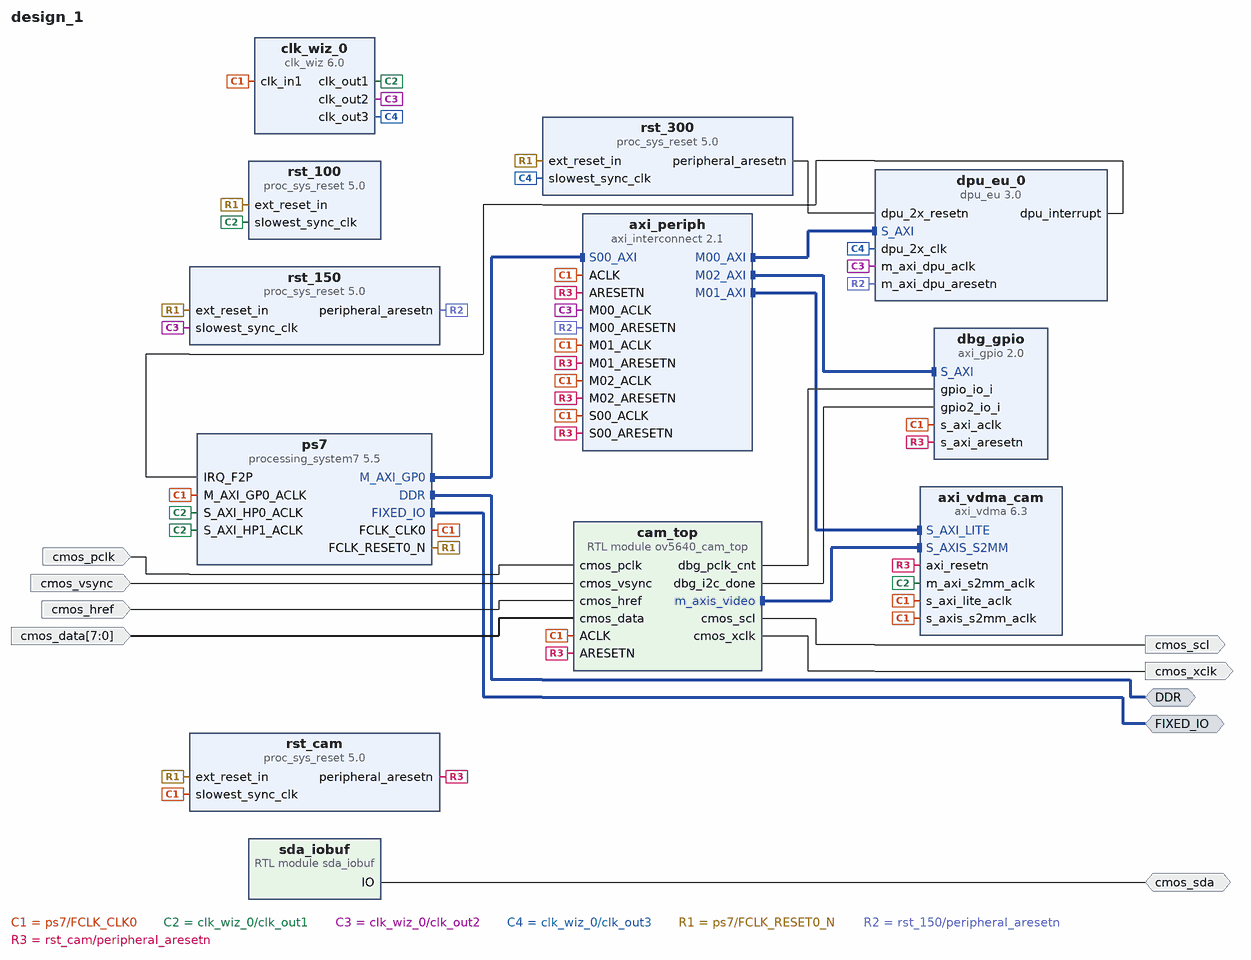
[diagram p0: block diagram of the top level]
# Vivado block design design_1, xc7z020clg400-2, Vivado 2019.1
create_bd_design design_1

create_bd_intf_port -mode Master -vlnv xilinx.com:interface:ddrx_rtl:1.0 DDR
create_bd_intf_port -mode Master -vlnv xilinx.com:display_processing_system7:fixedio_rtl:1.0 FIXED_IO
create_bd_port -dir O cmos_xclk
create_bd_port -dir O cmos_scl
create_bd_port -dir I cmos_pclk
create_bd_port -dir I cmos_vsync
create_bd_port -dir I cmos_href
create_bd_port -dir I -from 7 -to 0 cmos_data
create_bd_port -dir IO cmos_sda

create_bd_cell -type ip -vlnv xilinx.com:ip:processing_system7:5.5 ps7
set_property -dict [list \
  CONFIG.PCW_APU_PERIPHERAL_FREQMHZ 666.666666 \
  CONFIG.PCW_ENET0_ENET0_IO EMIO \
  CONFIG.PCW_ENET0_GRP_MDIO_ENABLE 0 \
  CONFIG.PCW_ENET0_PERIPHERAL_ENABLE 1 \
  CONFIG.PCW_ENET1_PERIPHERAL_CLKSRC External \
  CONFIG.PCW_FCLK_CLK0_BUF FALSE \
  CONFIG.PCW_FPGA0_PERIPHERAL_FREQMHZ 50 \
  CONFIG.PCW_FPGA1_PERIPHERAL_FREQMHZ 200 \
  CONFIG.PCW_GP0_EN_MODIFIABLE_TXN 0 \
  CONFIG.PCW_GP1_EN_MODIFIABLE_TXN 0 \
  CONFIG.PCW_GPIO_MIO_GPIO_ENABLE 0 \
  CONFIG.PCW_IRQ_F2P_INTR 1 \
  CONFIG.PCW_PERIPHERAL_BOARD_PRESET None \
  CONFIG.PCW_PRESET_BANK1_VOLTAGE {LVCMOS 1.8V} \
  CONFIG.PCW_QSPI_GRP_SINGLE_SS_ENABLE 1 \
  CONFIG.PCW_QSPI_GRP_SINGLE_SS_IO {MIO 1 .. 6} \
  CONFIG.PCW_QSPI_PERIPHERAL_ENABLE 1 \
  CONFIG.PCW_QSPI_PERIPHERAL_FREQMHZ 125 \
  CONFIG.PCW_QSPI_QSPI_IO {MIO 1 .. 6} \
  CONFIG.PCW_SD0_GRP_CD_ENABLE 0 \
  CONFIG.PCW_SD0_GRP_WP_ENABLE 0 \
  CONFIG.PCW_SD0_PERIPHERAL_ENABLE 1 \
  CONFIG.PCW_SD0_SD0_IO {MIO 40 .. 45} \
  CONFIG.PCW_SD1_PERIPHERAL_ENABLE 1 \
  CONFIG.PCW_SD1_SD1_IO {MIO 10 .. 15} \
  CONFIG.PCW_SDIO_PERIPHERAL_FREQMHZ 100 \
  CONFIG.PCW_SINGLE_QSPI_DATA_MODE x4 \
  CONFIG.PCW_UART1_PERIPHERAL_ENABLE 1 \
  CONFIG.PCW_UART1_UART1_IO {MIO 48 .. 49} \
  CONFIG.PCW_UART_PERIPHERAL_FREQMHZ 100 \
  CONFIG.PCW_USB0_PERIPHERAL_ENABLE 1 \
  CONFIG.PCW_USB0_USB0_IO {MIO 28 .. 39} \
  CONFIG.PCW_USE_FABRIC_INTERRUPT 1 \
  CONFIG.PCW_USE_S_AXI_HP0 1 \
  CONFIG.PCW_USE_S_AXI_HP1 1 \
] [get_bd_cells ps7]
# 367 more settings of ps7 are not shown: defaults, MIO pin electricals, DDR timing, and values the tool derives
create_bd_cell -type ip -vlnv xilinx.com:ip:clk_wiz:6.0 clk_wiz_0
set_property -dict [list \
  CONFIG.CLKOUT1_REQUESTED_OUT_FREQ 100.000 \
  CONFIG.CLKOUT1_USED true \
  CONFIG.CLKOUT2_REQUESTED_OUT_FREQ 150.000 \
  CONFIG.CLKOUT2_USED true \
  CONFIG.CLKOUT3_REQUESTED_OUT_FREQ 300.000 \
  CONFIG.CLKOUT3_USED true \
  CONFIG.PRIM_IN_FREQ 50 \
  CONFIG.USE_LOCKED true \
  CONFIG.USE_PHASE_ALIGNMENT false \
  CONFIG.USE_RESET true \
] [get_bd_cells clk_wiz_0]
create_bd_cell -type ip -vlnv xilinx.com:ip:proc_sys_reset:5.0 rst_100
create_bd_cell -type ip -vlnv xilinx.com:ip:proc_sys_reset:5.0 rst_150
create_bd_cell -type ip -vlnv xilinx.com:ip:proc_sys_reset:5.0 rst_300
create_bd_cell -type ip -vlnv xilinx.com:ip:proc_sys_reset:5.0 rst_cam
create_bd_cell -type ip -vlnv xilinx.com:ip:dpu_eu:3.0 dpu_eu_0
set_property -dict [list \
  CONFIG.ARCH 1152 \
  CONFIG.CONV_RELU_ADDON 2 \
  CONFIG.DWCV_ENA 1 \
  CONFIG.LOAD_AUGM 0 \
  CONFIG.POOL_AVERAGE 0 \
  CONFIG.S_AXI_CLK_INDEPENDENT 0 \
  CONFIG.TIME_DAY 9 \
  CONFIG.TIME_HOUR 14 \
  CONFIG.TIME_MONTH 10 \
  CONFIG.TIME_QUARTER 2 \
  CONFIG.TIME_YEAR 26 \
  CONFIG.VER_DPU_NUM 1 \
] [get_bd_cells dpu_eu_0]
create_bd_cell -type ip -vlnv xilinx.com:ip:axi_vdma:6.3 axi_vdma_cam
set_property -dict [list \
  CONFIG.c_addr_width 32 \
  CONFIG.c_include_mm2s 0 \
  CONFIG.c_include_s2mm 1 \
  CONFIG.c_num_fstores 3 \
  CONFIG.c_s2mm_genlock_mode 0 \
  CONFIG.c_s2mm_max_burst_length 64 \
] [get_bd_cells axi_vdma_cam]
create_bd_cell -type module -reference ov5640_cam_top cam_top
create_bd_cell -type module -reference sda_iobuf sda_iobuf
create_bd_cell -type ip -vlnv xilinx.com:ip:axi_interconnect:2.1 axi_periph
set_property -dict {CONFIG.NUM_MI 3 CONFIG.NUM_SI 1} [get_bd_cells axi_periph]
create_bd_cell -type ip -vlnv xilinx.com:ip:axi_gpio:2.0 dbg_gpio
set_property -dict [list \
  CONFIG.C_ALL_INPUTS 1 \
  CONFIG.C_ALL_INPUTS_2 1 \
  CONFIG.C_GPIO2_WIDTH 1 \
  CONFIG.C_GPIO_WIDTH 8 \
  CONFIG.C_IS_DUAL 1 \
] [get_bd_cells dbg_gpio]

# ---- connections ----

connect_bd_intf_net [get_bd_intf_ports DDR] [get_bd_intf_pins ps7/DDR]
connect_bd_intf_net [get_bd_intf_ports FIXED_IO] [get_bd_intf_pins ps7/FIXED_IO]
connect_bd_intf_net [get_bd_intf_pins cam_top/m_axis_video] [get_bd_intf_pins axi_vdma_cam/S_AXIS_S2MM]
connect_bd_intf_net [get_bd_intf_pins axi_periph/M02_AXI] [get_bd_intf_pins dbg_gpio/S_AXI]
connect_bd_intf_net [get_bd_intf_pins ps7/M_AXI_GP0] [get_bd_intf_pins axi_periph/S00_AXI]
connect_bd_intf_net [get_bd_intf_pins axi_periph/M01_AXI] [get_bd_intf_pins axi_vdma_cam/S_AXI_LITE]
connect_bd_intf_net [get_bd_intf_pins axi_periph/M00_AXI] [get_bd_intf_pins dpu_eu_0/S_AXI]
connect_bd_net [get_bd_pins ps7/FCLK_CLK0] \
  [get_bd_pins clk_wiz_0/clk_in1] [get_bd_pins rst_cam/slowest_sync_clk] [get_bd_pins axi_vdma_cam/s_axi_lite_aclk] \
  [get_bd_pins axi_vdma_cam/s_axis_s2mm_aclk] [get_bd_pins cam_top/ACLK] [get_bd_pins axi_periph/ACLK] \
  [get_bd_pins axi_periph/S00_ACLK] [get_bd_pins axi_periph/M01_ACLK] [get_bd_pins ps7/M_AXI_GP0_ACLK] \
  [get_bd_pins dbg_gpio/s_axi_aclk] [get_bd_pins axi_periph/M02_ACLK]
connect_bd_net [get_bd_pins clk_wiz_0/clk_out1] \
  [get_bd_pins rst_100/slowest_sync_clk] [get_bd_pins axi_vdma_cam/m_axi_s2mm_aclk] [get_bd_pins ps7/S_AXI_HP0_ACLK] \
  [get_bd_pins ps7/S_AXI_HP1_ACLK]
connect_bd_net [get_bd_pins clk_wiz_0/clk_out2] \
  [get_bd_pins rst_150/slowest_sync_clk] [get_bd_pins dpu_eu_0/m_axi_dpu_aclk] [get_bd_pins axi_periph/M00_ACLK]
connect_bd_net [get_bd_pins clk_wiz_0/clk_out3] [get_bd_pins rst_300/slowest_sync_clk] [get_bd_pins dpu_eu_0/dpu_2x_clk]
connect_bd_net [get_bd_pins ps7/FCLK_RESET0_N] \
  [get_bd_pins rst_100/ext_reset_in] [get_bd_pins rst_150/ext_reset_in] [get_bd_pins rst_300/ext_reset_in] \
  [get_bd_pins rst_cam/ext_reset_in]
connect_bd_net [get_bd_pins rst_150/peripheral_aresetn] [get_bd_pins dpu_eu_0/m_axi_dpu_aresetn] [get_bd_pins axi_periph/M00_ARESETN]
connect_bd_net [get_bd_pins rst_300/peripheral_aresetn] [get_bd_pins dpu_eu_0/dpu_2x_resetn]
connect_bd_net [get_bd_pins dpu_eu_0/dpu_interrupt] [get_bd_pins ps7/IRQ_F2P]
connect_bd_net [get_bd_pins rst_cam/peripheral_aresetn] \
  [get_bd_pins axi_vdma_cam/axi_resetn] [get_bd_pins cam_top/ARESETN] [get_bd_pins axi_periph/ARESETN] \
  [get_bd_pins axi_periph/S00_ARESETN] [get_bd_pins axi_periph/M01_ARESETN] [get_bd_pins dbg_gpio/s_axi_aresetn] \
  [get_bd_pins axi_periph/M02_ARESETN]
connect_bd_net [get_bd_pins cam_top/cmos_xclk] [get_bd_ports cmos_xclk]
connect_bd_net [get_bd_ports cmos_pclk] [get_bd_pins cam_top/cmos_pclk]
connect_bd_net [get_bd_ports cmos_vsync] [get_bd_pins cam_top/cmos_vsync]
connect_bd_net [get_bd_ports cmos_href] [get_bd_pins cam_top/cmos_href]
connect_bd_net [get_bd_ports cmos_data] [get_bd_pins cam_top/cmos_data]
connect_bd_net [get_bd_pins cam_top/cmos_scl] [get_bd_ports cmos_scl]
connect_bd_net [get_bd_ports cmos_sda] [get_bd_pins sda_iobuf/IO]
connect_bd_net [get_bd_pins cam_top/dbg_pclk_cnt] [get_bd_pins dbg_gpio/gpio_io_i]
connect_bd_net [get_bd_pins cam_top/dbg_i2c_done] [get_bd_pins dbg_gpio/gpio2_io_i]

# ---- address map ----
assign_bd_address -offset 0x40000000 -range 16M -target_address_space [get_bd_addr_spaces ps7/Data] [get_bd_addr_segs dpu_eu_0/S_AXI/reg0]
assign_bd_address -offset 0x41220000 -range 64K -target_address_space [get_bd_addr_spaces ps7/Data] [get_bd_addr_segs dbg_gpio/S_AXI/Reg]
assign_bd_address -offset 0x43010000 -range 64K -target_address_space [get_bd_addr_spaces ps7/Data] [get_bd_addr_segs axi_vdma_cam/S_AXI_LITE/Reg]

validate_bd_design
save_bd_design
